# Altium project IoT_Universal_Terminal_mJazłowiecki.PrjPcb
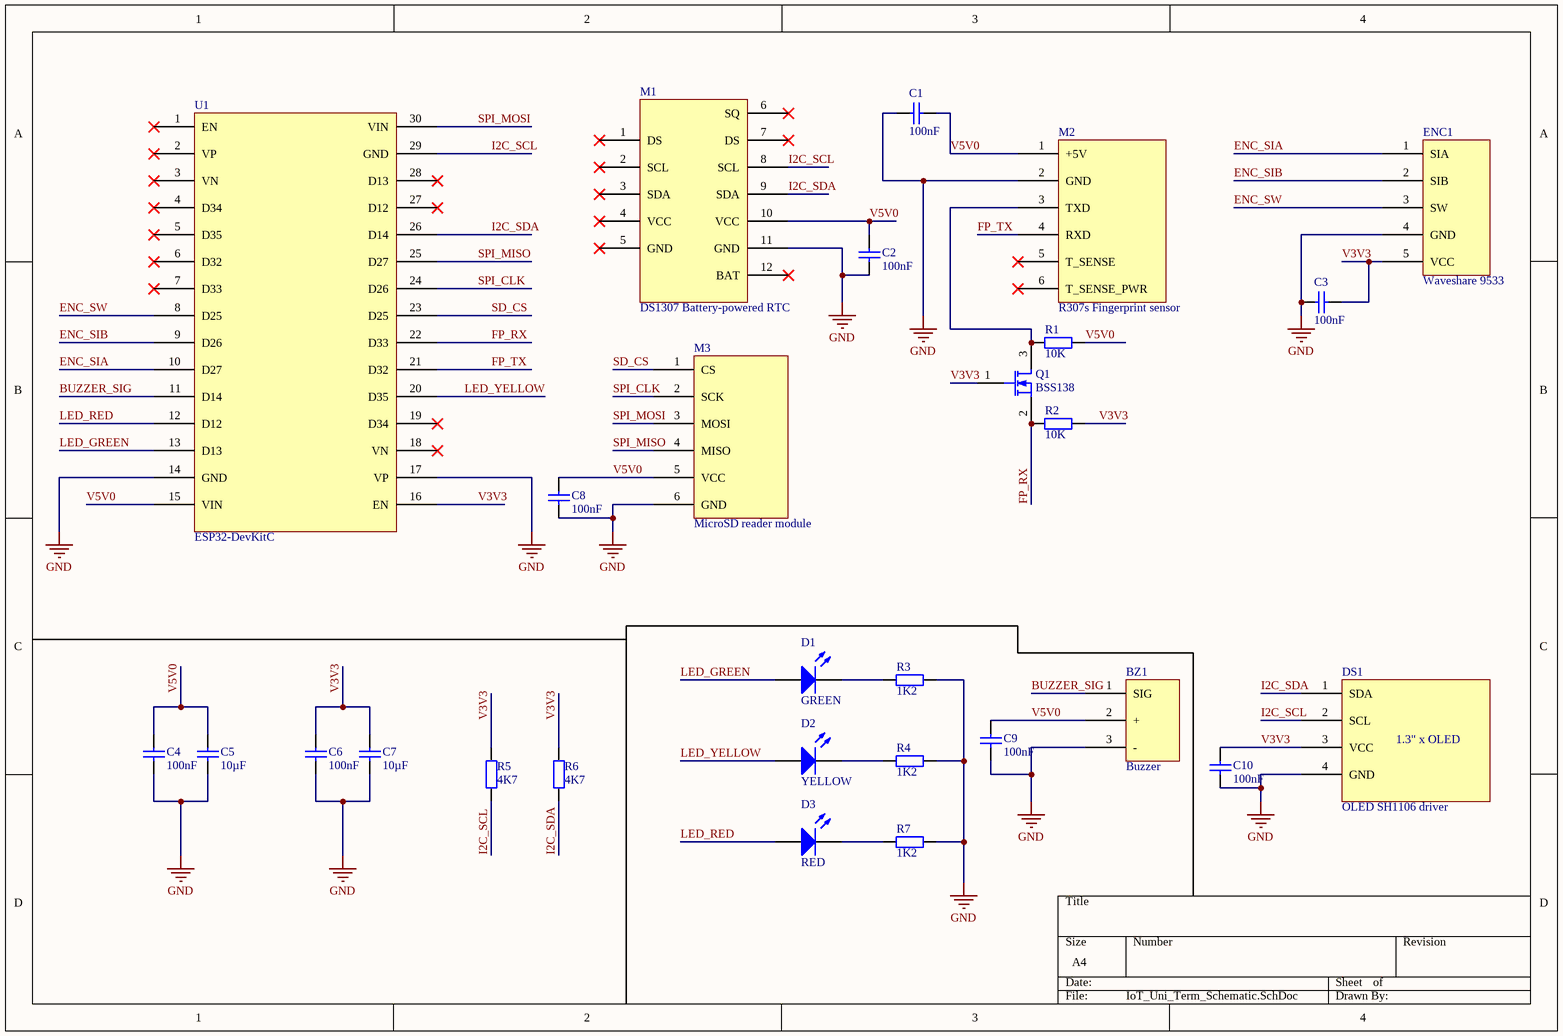
[diagram p0: IoT_Uni_Term_Schematic.SchDoc]
1 sheet, 28 parts. Net scope: global (net labels, ports and power ports of the same name join across sheets).
Board file: IoT_Uni_Tem_PCB.PcbDoc

## Sheet IoT_Uni_Term_Schematic.SchDoc
size A4; SheetNumber: 1; SheetTotal: 1; SPICEModelCachePMUXJGOG: <root> / <DocumentId>PMUXJGOG</DocumentId> / </root>

### Parts
BZ1  Buzzer  [MOJE_ZLACZE_3PIN]
C1  100nF  [Capacitor_FP-C1206C-EB-IPC_B]
C2  100nF  [Capacitor_FP-C1206C-EB-IPC_B]
C3  100nF  [Capacitor_FP-C1206C-EB-IPC_B]
C4  100nF  [Capacitor_FP-C1206C-EB-IPC_B]
C5  value 10µF  [Capacitor_FP-C1206C-EB-IPC_B]  (hidden comment: 100nF)
C6  100nF  [Capacitor_FP-C1206C-EB-IPC_B]
C7  10µF  [Capacitor_FP-C1206C-EB-IPC_B]
C8  100nF  [Capacitor_FP-C1206C-EB-IPC_B]
C9  100nF  [Capacitor_FP-C1206C-EB-IPC_B]
C10  100nF  [Capacitor_FP-C1206C-EB-IPC_B]
D1  GREEN  [MOJE_ZLACZE_2PIN]
D2  YELLOW  [MOJE_ZLACZE_2PIN]
D3  RED  [MOJE_ZLACZE_2PIN]
DS1  OLED SH1106 driver  [MOJE_ZLACZE_4PIN]
ENC1  Waveshare 9533  [MOJE_ZLACZE_5PIN]
M1  DS1307 Battery-powered RTC  [RTC_DS1307]
M2  R307s Fingerprint sensor  [MOJE_ZLACZE_6PIN]
M3  MicroSD reader module  [MOJE_ZLACZE_6PIN]
Q1  BSS138  [BSS138]
R1  10k  [RESISTOR 1206]
R2  10k  [RESISTOR 1206]
R3  value 1K2  [RESISTOR 1206]  (hidden comment: 10k)
R4  value 1K2  [RESISTOR 1206]  (hidden comment: 10k)
R5  value 4K7  [RESISTOR 1206]  (hidden comment: 10k)
R6  value 4K7  [RESISTOR 1206]  (hidden comment: 10k)
R7  value 1K2  [RESISTOR 1206]  (hidden comment: 10k)
U1  ESP32-DevKitC  [ESP32_DevKitC_WROOM-32_15x2PIN]

### Nets
GND: BZ1.3(-) C1.1 C2.1 C3.1 C4.1 C5.1 C6.1 C7.1 C8.1 C9.1 C10.1 DS1.4(GND) ENC1.4(GND) M1.11(GND) M2.2(GND) M3.6(GND) R3.2 R4.2 R7.2 U1.14(GND) U1.17(VP)
BUZZER_SIG: BZ1.1(SIG) U1.11(D14)
ENC_SIA: ENC1.1(SIA) U1.10(D27)
ENC_SIB: ENC1.2(SIB) U1.9(D26)
ENC_SW: ENC1.3(SW) U1.8(D25)
FP_RX: Q1.2(S) R2.2 U1.22(D33)
FP_TX: M2.4(RXD) U1.21(D32)
I2C_SCL: DS1.2(SCL) M1.8(SCL) R5.1 U1.29(GND)
I2C_SDA: DS1.1(SDA) M1.9(SDA) R6.1 U1.26(D14)
LED_GREEN: D1.1(A) U1.13(D13)
LED_RED: D3.1(A) U1.12(D12)
LED_YELLOW: D2.1(A) U1.20(D35)
SD_CS: M3.1(CS) U1.23(D25)
SPI_CLK: M3.2(SCK) U1.24(D26)
SPI_MISO: M3.4(MISO) U1.25(D27)
SPI_MOSI: M3.3(MOSI) U1.30(VIN)
V3V3: C3.1 C6.1 C7.1 C10.1 DS1.3(VCC) ENC1.5(VCC) Q1.1(G) R2.1 R5.2 R6.2 U1.16(EN)
V5V0: BZ1.2(+) C1.1 C2.1 C4.1 C5.1 C8.1 C9.1 M1.10(VCC) M2.1(+5V) M3.5(VCC) R1.1 U1.15(VIN)
NetD1_2: D1.2(K) R3.1
NetD2_2: D2.2(K) R4.1
NetD3_2: D3.2(K) R7.1
NetM2_3: M2.3(TXD) Q1.3(D) R1.2

Not connected (* = marked no-connect by the designer): M1 1(DS)* 2(SCL)* 3(SDA)* 4(VCC)* 5(GND)* 6(SQ)* 7(DS)* 12(BAT)*; M2 5(T_SENSE)* 6(T_SENSE_PWR)*; U1 1(EN)* 2(VP)* 3(VN)* 4(D34)* 5(D35)* 6(D32)* 7(D33)* 18(VN)* 19(D34)* 27(D12)* 28(D13)*

### Library data of the parts
BZ1 = Buzzer: positive, negative terminals + input signal
C1-C10 = Cap: Capacitor; Published: 8-Jun-2000; LatestRevisionDate: 17-Jul-2002; LatestRevisionNote: Re-released for DXP Platform.; PackageReference: RAD-0.3; Publisher: Altium Limited; PackageDescription: Radial Cap, Thru-Hole; 2 Leads; 0.3 in Pin Spacing
  C1-C4 C6 C8-C10: Value: 100nF
  C7: Value: 10µF
D1-D3 = LED2: Typical RED, GREEN, YELLOW, AMBER GaAs LED; Published: 8-Jun-2000; LatestRevisionDate: 17-Jul-2002; LatestRevisionNote: Re-released for DXP Platform.; PackageVersion: Feb-2002; PackageReference: 3.2X1.6X1.1; Publisher: Altium Limited; PackageDescription: SM LED; 2 Flat Leads
DS1 = OLED 1,3": Blue 1.3" graphics OLED display 128x64px I2C v2 - Blue Font
ENC1 = Waveshare 9533: compact rotary encoder module featuring a built-in button, designed to detect clockwise and anti-clockwise rotation for menu navigation, volume control, or motor positioning
M1 = RTC DS1307: RTC CR2032 BATTERY POWERED, REAL TIME CLOCK. I2C + 32kB EEPROM
M2 = GROW R307S: optical fingerprint sensor module from Hangzhou Grow Technology Co., Ltd. It features a high-speed DSP processor, flash memory for storage
M3 = microSD Card module: SPI INTERFACE, 2.54mm, 3.3V - 5.0V
Q1 = MOSFET-N: N-Channel MOSFET; Published: 8-Jun-2000; LatestRevisionDate: 17-Jul-2002; LatestRevisionNote: Re-released for DXP Platform.; PackageVersion: 1995/1996; PackageReference: E3; Publisher: Altium Limited; PackageDescription: TO, Flat Index; 3 In-Line, Axial Leads; Body Dia. 4.6mm; Lead Dia. 0.5 mm (max)
R1-R7 = Res2: Resistor; Published: 8-Jun-2000; LatestRevisionDate: 17-Jul-2002; LatestRevisionNote: Re-released for DXP Platform.; PackageReference: AXIAL-0.4; Publisher: Altium Limited; PackageDescription: Axial Device, Thru-Hole; 2 Leads; 0.4 in Pin Spacing
  R1 R2: Value: 10K
U1 = ESP32-DevKitC: ESP32-based development board produced by Espressif